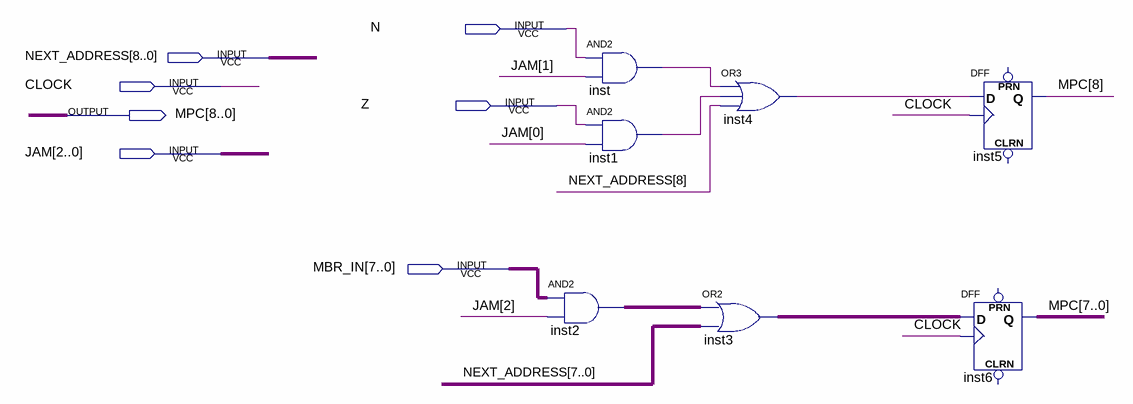
[diagram p0: schematic sheet]
// Quartus schematic MPC_GENERATOR.bdf as structural Verilog: 7 symbols, 7 pins
module MPC_GENERATOR (
  input  N,
  input  [8:0] NEXT_ADDRESS,
  input  CLOCK,
  input  Z,
  input  [2:0] JAM,
  input  [7:0] MBR_IN,
  output [8:0] MPC
);

  wire inst1_out, inst4_out, inst_out;
  wire [7:0] inst2_out, inst3_out;

  and inst (inst_out, N, JAM[1]);
  and inst1 (inst1_out, Z, JAM[0]);
  assign inst2_out = MBR_IN & {8{JAM[2]}};  // AND2 inst2, 8 bits wide
  or inst4 (inst4_out, inst_out, inst1_out, NEXT_ADDRESS[8]);
  assign inst3_out = inst2_out | NEXT_ADDRESS[7:0];  // OR2 inst3, 8 bits wide
  DFF inst5 (.CLK(CLOCK), .D(inst4_out), .Q(MPC[8]));  // open: CLRN, PRN
  DFF inst6[7:0] (.CLK(CLOCK), .D(inst3_out), .Q(MPC[7:0]));  // open: CLRN, PRN
endmodule
